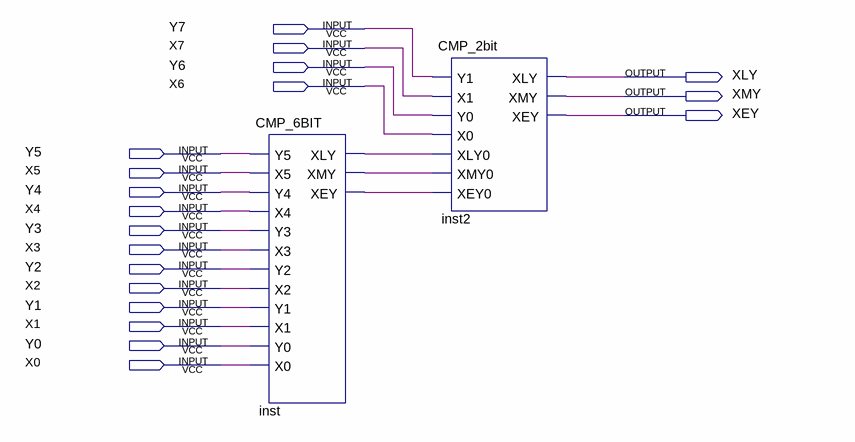
[diagram p0: schematic sheet]
// Quartus schematic CMP_8BIT.bdf as structural Verilog: 2 symbols, 19 pins
module CMP_8BIT (
  input  Y7,
  input  X7,
  input  Y6,
  input  X6,
  input  Y5,
  input  X5,
  input  Y4,
  input  X4,
  input  Y3,
  input  X3,
  input  Y2,
  input  X2,
  input  Y1,
  input  X1,
  input  Y0,
  input  X0,
  output XLY,
  output XMY,
  output XEY
);

  wire inst_xey, inst_xly, inst_xmy;

  CMP_6BIT inst (
    .Y5(Y5), .X5(X5), .Y4(Y4), .X4(X4), .Y3(Y3), .X3(X3), .Y2(Y2), .X2(X2), .Y1(Y1), .X1(X1), .Y0(Y0),
    .X0(X0), .XLY(inst_xly), .XMY(inst_xmy), .XEY(inst_xey));
  CMP_2bit inst2 (
    .Y1(Y7), .X1(X7), .Y0(Y6), .X0(X6), .XLY0(inst_xly), .XMY0(inst_xmy), .XEY0(inst_xey), .XLY(XLY),
    .XMY(XMY), .XEY(XEY));
endmodule
